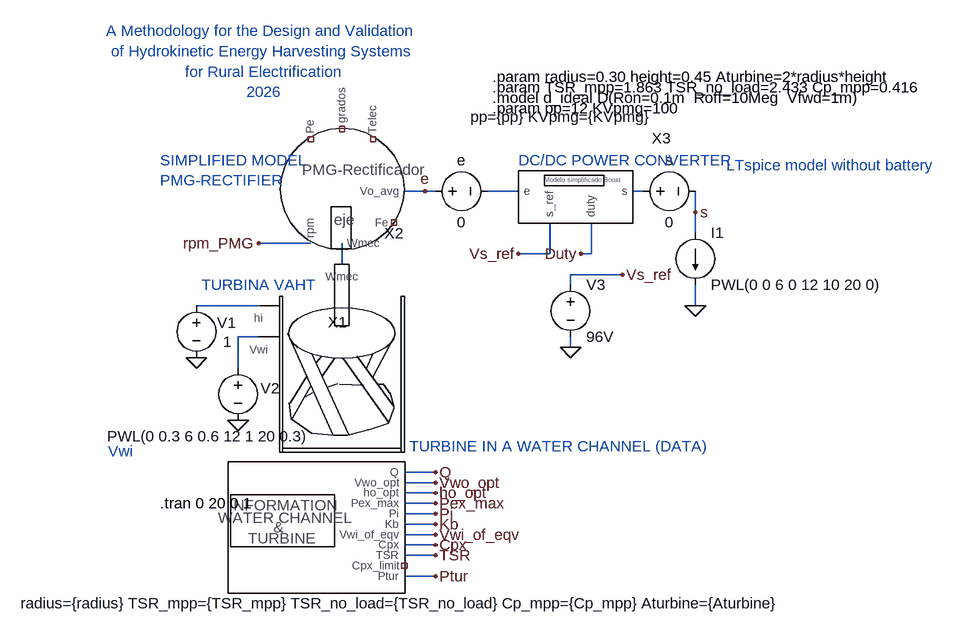
[diagram p0: schematic test_1.asc]
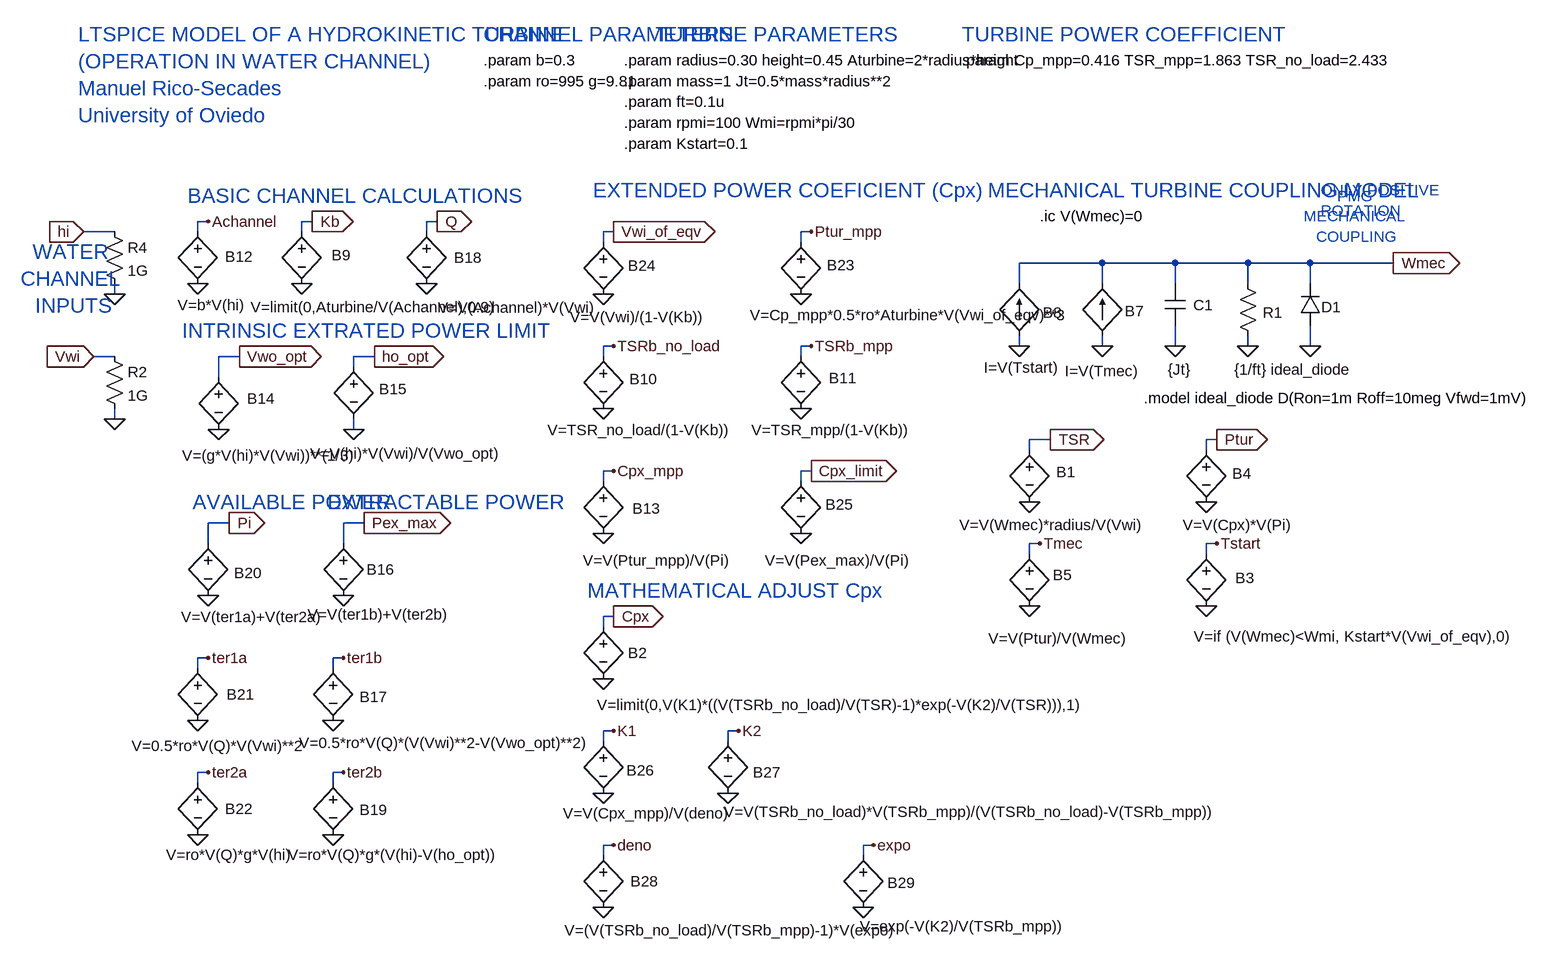
[diagram p1: sub-circuit turbina_canal.asc]
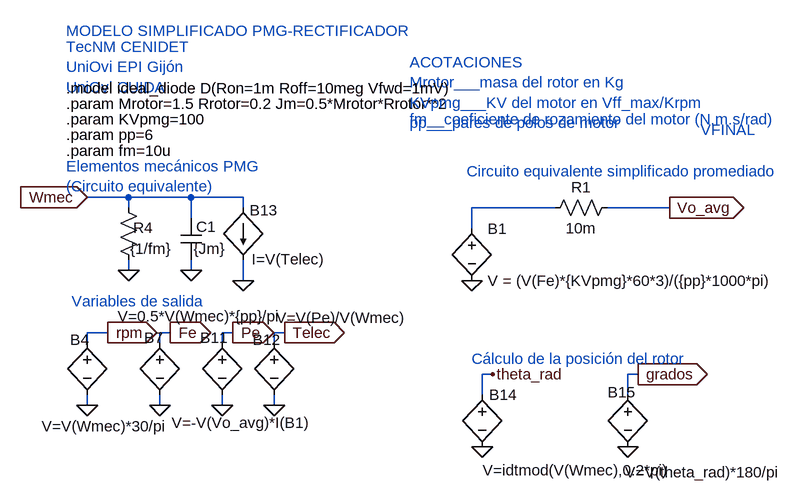
[diagram p2: sub-circuit pmg_con_rect_simple.asc]
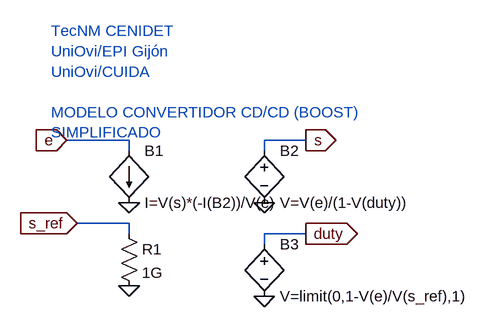
[diagram p3: sub-circuit modelo_cc_cc_boost.asc]
test_1.asc, the LTspice schematic file:
Version 4.1
SHEET 1 1700 736
WIRE -560 -480 -592 -480
WIRE -544 -480 -560 -480
WIRE -416 -480 -464 -480
WIRE -224 -480 -240 -480
WIRE -144 -448 -144 -480
WIRE -144 -416 -144 -448
WIRE -736 -400 -816 -400
WIRE -368 -384 -368 -432
WIRE -368 -384 -416 -384
WIRE -304 -384 -304 -432
WIRE -304 -384 -320 -384
WIRE -688 -368 -688 -400
WIRE -256 -352 -336 -352
WIRE -336 -336 -336 -352
WIRE -816 -304 -912 -304
WIRE -144 -304 -144 -336
WIRE -816 -256 -848 -256
WIRE -336 -240 -336 -256
WIRE -848 -208 -848 -256
WIRE -544 -48 -592 -48
WIRE -544 -32 -592 -32
WIRE -544 -16 -592 -16
WIRE -544 0 -592 0
WIRE -544 16 -592 16
WIRE -544 32 -592 32
WIRE -544 48 -592 48
WIRE -544 64 -592 64
WIRE -544 80 -592 80
WIRE -544 112 -592 112
FLAG -912 -224 0
FLAG -848 -128 0
FLAG -544 64 Cpx
FLAG -544 80 TSR
FLAG -544 112 Ptur
FLAG -560 -480 e
FLAG -816 -400 rpm_PMG
FLAG -544 -48 Q
FLAG -544 -32 Vwo_opt
FLAG -544 0 Pex_max
FLAG -544 16 Pi
FLAG -544 32 Kb
FLAG -544 -16 ho_opt
FLAG -544 48 Vwi_of_eqv
FLAG -144 -304 0
FLAG -416 -384 Vs_ref
FLAG -320 -384 Duty
FLAG -336 -240 0
FLAG -256 -352 Vs_ref
FLAG -144 -448 s
SYMBOL turbina_canal -688 -272 R0
WINDOW 0 -7 9 Bottom 2
WINDOW 39 100 441 Bottom 2
SYMATTR InstName X1
SYMATTR SpiceLine radius={radius} TSR_mpp={TSR_mpp} TSR_no_load={TSR_no_load} Cp_mpp={Cp_mpp} Aturbine={Aturbine}
SYMBOL voltage -912 -320 R0
WINDOW 0 32 42 Left 2
WINDOW 3 41 71 Left 2
WINDOW 123 0 0 Left 0
WINDOW 39 0 0 Left 0
SYMATTR InstName V1
SYMATTR Value 1
SYMBOL voltage -848 -224 R0
WINDOW 0 35 47 Left 2
WINDOW 3 -201 121 Left 2
WINDOW 123 0 0 Left 0
WINDOW 39 0 0 Left 0
SYMATTR InstName V2
SYMATTR Value PWL(0 0.3 6 0.6 12 1 20 0.3)
SYMBOL pmg_con_rect_simple -656 -512 R0
WINDOW 0 48 112 Bottom 2
WINDOW 39 306 -67 Bottom 2
SYMATTR InstName X2
SYMATTR SpiceLine pp={pp} KVpmg={KVpmg}
SYMBOL voltage -560 -480 R270
WINDOW 0 32 56 VTop 2
WINDOW 3 -32 56 VBottom 2
SYMATTR InstName e
SYMATTR Value 0
SYMBOL modelo_cc_cc_boost -336 -464 R0
WINDOW 0 140 -82 Bottom 2
SYMATTR InstName X3
SYMBOL current -144 -416 R0
WINDOW 123 0 0 Left 0
WINDOW 39 0 0 Left 0
SYMATTR InstName I1
SYMATTR Value PWL(0 0 6 0 12 10 20 0)
SYMBOL voltage -240 -480 R270
WINDOW 0 32 56 VTop 2
WINDOW 3 -32 56 VBottom 2
SYMATTR InstName s
SYMATTR Value 0
SYMBOL voltage -336 -352 R0
WINDOW 123 0 0 Left 0
WINDOW 39 0 0 Left 0
SYMATTR InstName V3
SYMATTR Value 96V
TEXT -968 0 Left 2 !.tran 0 20 0 1
TEXT -456 -624 Left 2 !.model d_ideal D(Ron=0.1m  Roff=10Meg  Vfwd=1m)
TEXT -456 -608 Left 2 !.param pp=12 KVpmg=100
TEXT -456 -640 Left 2 !.param TSR_mpp=1.863 TSR_no_load=2.433 Cp_mpp=0.416
TEXT -456 -656 Left 2 !.param radius=0.30 height=0.45 Aturbine=2*radius*height
TEXT -808 -680 Center 2 ;A Methodology for the Design and Validation \nof Hydrokinetic Energy Harvesting Systems \nfor Rural Electrification\n2026
TEXT -416 -528 Left 2 ;DC/DC POWER CONVERTER
TEXT -584 -88 Left 2 ;TURBINE IN A WATER CHANNEL (DATA)
TEXT -968 -528 Left 2 ;SIMPLIFIED MODEL \nPMG-RECTIFIER
TEXT -1048 -80 Left 2 ;Vwi
TEXT -904 -336 Left 2 ;TURBINA VAHT
TEXT -96 -520 Left 2 ;LTspice model without battery

turbina_canal.asc, the sub-circuit schematic file:
Version 4.1
SHEET 1 1700 736
WIRE -1392 -544 -1408 -544
WIRE -1232 -544 -1248 -544
WIRE -1040 -544 -1056 -544
WIRE -1536 -528 -1584 -528
WIRE -1408 -528 -1408 -544
WIRE -1248 -528 -1248 -544
WIRE -1056 -528 -1056 -544
WIRE -768 -528 -784 -528
WIRE -464 -528 -480 -528
WIRE -784 -512 -784 -528
WIRE -480 -512 -480 -528
WIRE -16 -480 -144 -480
WIRE 96 -480 -16 -480
WIRE 208 -480 96 -480
WIRE 304 -480 208 -480
WIRE 432 -480 304 -480
WIRE -144 -448 -144 -480
WIRE -16 -448 -16 -480
WIRE 96 -448 96 -480
WIRE 208 -448 208 -480
WIRE 304 -448 304 -480
WIRE -1536 -432 -1536 -448
WIRE -768 -352 -784 -352
WIRE -464 -352 -480 -352
WIRE -144 -352 -144 -368
WIRE -16 -352 -16 -368
WIRE 96 -352 96 -384
WIRE 208 -352 208 -368
WIRE 304 -352 304 -384
WIRE -1536 -336 -1568 -336
WIRE -1344 -336 -1376 -336
WIRE -1136 -336 -1168 -336
WIRE -784 -336 -784 -352
WIRE -480 -336 -480 -352
WIRE -1168 -320 -1168 -336
WIRE -1376 -304 -1376 -336
WIRE -1536 -240 -1536 -256
WIRE -1168 -224 -1168 -240
WIRE -96 -208 -128 -208
WIRE 160 -208 144 -208
WIRE -128 -192 -128 -208
WIRE 144 -192 144 -208
WIRE -768 -160 -784 -160
WIRE -464 -160 -480 -160
WIRE -784 -144 -784 -160
WIRE -480 -144 -480 -160
WIRE -1360 -80 -1392 -80
WIRE -1152 -80 -1184 -80
WIRE -1392 -48 -1392 -80
WIRE -1184 -48 -1184 -80
WIRE -112 -48 -128 -48
WIRE 160 -48 144 -48
WIRE -128 -32 -128 -48
WIRE 144 -32 144 -48
WIRE -768 64 -784 64
WIRE -784 80 -784 64
WIRE -1392 128 -1408 128
WIRE -1184 128 -1200 128
WIRE -1408 144 -1408 128
WIRE -1200 144 -1200 128
WIRE -768 240 -784 240
WIRE -576 240 -592 240
WIRE -784 256 -784 240
WIRE -592 256 -592 240
WIRE -1392 304 -1408 304
WIRE -1184 304 -1200 304
WIRE -1408 320 -1408 304
WIRE -1200 320 -1200 304
WIRE -768 416 -784 416
WIRE -368 416 -384 416
WIRE -784 432 -784 416
WIRE -384 432 -384 416
FLAG -1568 -336 Vwi
IOPIN -1568 -336 In
FLAG -1536 -240 0
FLAG -128 -112 0
FLAG -96 -208 TSR
IOPIN -96 -208 Out
FLAG -784 160 0
FLAG -768 64 Cpx
IOPIN -768 64 Out
FLAG 144 -112 0
FLAG 160 -208 Ptur
IOPIN 160 -208 Out
FLAG -128 48 0
FLAG -112 -48 Tmec
FLAG -16 -352 0
FLAG 96 -352 0
FLAG 432 -480 Wmec
IOPIN 432 -480 Out
FLAG 208 -352 0
FLAG -144 -352 0
FLAG -1248 -448 0
FLAG -1232 -544 Kb
IOPIN -1232 -544 Out
FLAG -784 -256 0
FLAG -768 -352 TSRb_no_load
FLAG -480 -256 0
FLAG -464 -352 TSRb_mpp
FLAG -1584 -528 hi
IOPIN -1584 -528 In
FLAG -1536 -432 0
FLAG -1408 -448 0
FLAG -1392 -544 Achannel
FLAG -784 -64 0
FLAG -768 -160 Cpx_mpp
FLAG -1376 -224 0
FLAG -1344 -336 Vwo_opt
IOPIN -1344 -336 Out
FLAG -1136 -336 ho_opt
IOPIN -1136 -336 Out
FLAG -1168 -224 0
FLAG -1152 -80 Pex_max
IOPIN -1152 -80 Out
FLAG -1184 32 0
FLAG -1200 224 0
FLAG -1184 128 ter1b
FLAG -1056 -448 0
FLAG -1040 -544 Q
IOPIN -1040 -544 Out
FLAG -1200 400 0
FLAG -1184 304 ter2b
FLAG -1360 -80 Pi
IOPIN -1360 -80 Out
FLAG -1392 32 0
FLAG -1408 224 0
FLAG -1392 128 ter1a
FLAG -1408 400 0
FLAG -1392 304 ter2a
FLAG -480 -432 0
FLAG -464 -528 Ptur_mpp
FLAG -784 -432 0
FLAG -768 -528 Vwi_of_eqv
IOPIN -768 -528 Out
FLAG -480 -64 0
FLAG -464 -160 Cpx_limit
IOPIN -464 -160 Out
FLAG -784 336 0
FLAG -768 240 K1
FLAG -592 336 0
FLAG -576 240 K2
FLAG -784 512 0
FLAG -768 416 deno
FLAG -384 512 0
FLAG -368 416 expo
FLAG 144 48 0
FLAG 160 -48 Tstart
FLAG 304 -352 0
SYMBOL res -1552 -352 R0
SYMATTR InstName R2
SYMATTR Value 1G
SYMBOL bv -128 -208 R0
WINDOW 3 -108 131 Left 2
WINDOW 0 41 50 Left 2
SYMATTR Value V=V(Wmec)*radius/V(Vwi)
SYMATTR InstName B1
SYMBOL bv -784 64 R0
WINDOW 3 -10 136 Left 2
WINDOW 0 38 56 Left 2
SYMATTR Value V=limit(0,V(K1)*((V(TSRb_no_load)/V(TSR)-1)*exp(-V(K2)/V(TSR))),1)
SYMATTR InstName B2
SYMBOL bv 144 -208 R0
WINDOW 3 -36 131 Left 2
WINDOW 0 40 52 Left 2
SYMATTR Value V=V(Cpx)*V(Pi)
SYMATTR InstName B4
SYMBOL bv -128 -48 R0
WINDOW 3 -63 146 Left 2
WINDOW 0 36 48 Left 2
SYMATTR Value V=V(Ptur)/V(Wmec)
SYMATTR InstName B5
SYMBOL bi -16 -368 R180
WINDOW 0 -64 38 Left 2
WINDOW 3 -56 -54 Left 2
SYMATTR InstName B7
SYMATTR Value I=V(Tmec)
SYMBOL cap 80 -448 R0
WINDOW 3 5 132 Left 2
WINDOW 0 44 33 Left 2
SYMATTR Value {Jt}
SYMATTR InstName C1
SYMBOL res 192 -464 R0
WINDOW 3 -5 148 Left 2
WINDOW 0 39 60 Left 2
SYMATTR Value {1/ft}
SYMATTR InstName R1
SYMBOL bi -144 -368 R180
WINDOW 0 -66 36 Left 2
WINDOW 3 -61 -49 Left 2
SYMATTR InstName B8
SYMATTR Value I=V(Tstart)
SYMBOL bv -1248 -544 R0
WINDOW 0 46 52 Left 2
WINDOW 3 -79 132 Left 2
SYMATTR InstName B9
SYMATTR Value V=limit(0,Aturbine/V(Achannel),0.9)
SYMBOL bv -784 -352 R0
WINDOW 0 40 51 Left 2
WINDOW 3 -86 129 Left 2
SYMATTR InstName B10
SYMATTR Value V=TSR_no_load/(1-V(Kb))
SYMBOL bv -480 -352 R0
WINDOW 0 43 49 Left 2
WINDOW 3 -76 129 Left 2
SYMATTR InstName B11
SYMATTR Value V=TSR_mpp/(1-V(Kb))
SYMBOL res -1552 -544 R0
SYMATTR InstName R4
SYMATTR Value 1G
SYMBOL bv -1408 -544 R0
WINDOW 0 42 54 Left 2
WINDOW 3 -31 129 Left 2
SYMATTR InstName B12
SYMATTR Value V=b*V(hi)
SYMBOL bv -784 -160 R0
WINDOW 0 45 58 Left 2
WINDOW 3 -31 138 Left 2
SYMATTR InstName B13
SYMATTR Value V=V(Ptur_mpp)/V(Pi)
SYMBOL bv -1376 -320 R0
WINDOW 0 44 49 Left 2
WINDOW 3 -56 136 Left 2
SYMATTR InstName B14
SYMATTR Value V=(g*V(hi)*V(Vwi))**(1/3)
SYMBOL bv -1168 -336 R0
WINDOW 0 39 50 Left 2
WINDOW 3 -67 149 Left 2
SYMATTR InstName B15
SYMATTR Value V=V(hi)*V(Vwi)/V(Vwo_opt)
SYMBOL bv -1184 -64 R0
WINDOW 0 36 56 Left 2
WINDOW 3 -55 125 Left 2
SYMATTR InstName B16
SYMATTR Value V=V(ter1b)+V(ter2b)
SYMBOL bv -1200 128 R0
WINDOW 0 41 60 Left 2
WINDOW 3 -52 131 Left 2
SYMATTR InstName B17
SYMATTR Value V=0.5*ro*V(Q)*(V(Vwi)**2-V(Vwo_opt)**2)
SYMBOL bv -1056 -544 R0
WINDOW 0 42 56 Left 2
WINDOW 3 18 133 Left 2
SYMATTR InstName B18
SYMATTR Value V=V(Achannel)*V(Vwi)
SYMBOL bv -1200 304 R0
WINDOW 0 41 58 Left 2
WINDOW 3 -69 127 Left 2
SYMATTR InstName B19
SYMATTR Value V=ro*V(Q)*g*(V(hi)-V(ho_opt))
SYMBOL bv -1392 -64 R0
WINDOW 0 40 61 Left 2
WINDOW 3 -42 129 Left 2
SYMATTR InstName B20
SYMATTR Value V=V(ter1a)+V(ter2a)
SYMBOL bv -1408 128 R0
WINDOW 0 44 56 Left 2
WINDOW 3 -102 135 Left 2
SYMATTR InstName B21
SYMATTR Value V=0.5*ro*V(Q)*V(Vwi)**2
SYMBOL bv -1408 304 R0
WINDOW 0 42 56 Left 2
WINDOW 3 -49 127 Left 2
SYMATTR InstName B22
SYMATTR Value V=ro*V(Q)*g*V(hi)
SYMBOL bv -480 -528 R0
WINDOW 0 40 51 Left 2
WINDOW 3 -78 128 Left 2
SYMATTR InstName B23
SYMATTR Value V=Cp_mpp*0.5*ro*Aturbine*V(Vwi_of_eqv)**3
SYMBOL bv -784 -528 R0
WINDOW 0 38 52 Left 2
WINDOW 3 -51 131 Left 2
SYMATTR InstName B24
SYMATTR Value V=V(Vwi)/(1-V(Kb))
SYMBOL bv -480 -160 R0
WINDOW 0 38 52 Left 2
WINDOW 3 -55 138 Left 2
SYMATTR InstName B25
SYMATTR Value V=V(Pex_max)/V(Pi)
SYMBOL bv -784 240 R0
WINDOW 0 36 61 Left 2
WINDOW 3 -62 127 Left 2
SYMATTR InstName B26
SYMATTR Value V=V(Cpx_mpp)/V(deno)
SYMBOL bv -592 240 R0
WINDOW 0 38 64 Left 2
WINDOW 3 -6 125 Left 2
SYMATTR InstName B27
SYMATTR Value V=V(TSRb_no_load)*V(TSRb_mpp)/(V(TSRb_no_load)-V(TSRb_mpp))
SYMBOL bv -784 416 R0
WINDOW 0 42 56 Left 2
WINDOW 3 -60 131 Left 2
SYMATTR InstName B28
SYMATTR Value V=(V(TSRb_no_load)/V(TSRb_mpp)-1)*V(expo)
SYMBOL bv -384 416 R0
WINDOW 0 37 58 Left 2
WINDOW 3 -5 125 Left 2
SYMATTR InstName B29
SYMATTR Value V=exp(-V(K2)/V(TSRb_mpp))
SYMBOL bv 144 -48 R0
WINDOW 0 45 53 Left 2
WINDOW 3 -19 143 Left 2
SYMATTR InstName B3
SYMATTR Value V=if (V(Wmec)<Wmi, Kstart*V(Vwi_of_eqv),0)
SYMBOL diode 320 -384 R180
WINDOW 0 -32 28 Left 2
WINDOW 3 -47 -68 Left 2
SYMATTR InstName D1
SYMATTR Value ideal_diode
TEXT -752 -792 Left 2 !.param radius=0.30 height=0.45 Aturbine=2*radius*height
TEXT -232 -792 Left 2 !.param Cp_mpp=0.416 TSR_mpp=1.863 TSR_no_load=2.433
TEXT -752 -760 Left 2 !.param mass=1 Jt=0.5*mass*radius**2
TEXT -112 -552 Left 2 !.ic V(Wmec)=0
TEXT -752 -696 Left 2 !.param rpmi=100 Wmi=rpmi*pi/30
TEXT -752 -728 Left 2 !.param ft=0.1u
TEXT -752 -664 Left 2 !.param Kstart=0.1
TEXT -704 -832 Left 3 ;TURBINE PARAMETERS
TEXT -232 -832 Left 3 ;TURBINE POWER COEFFICIENT
TEXT -968 -832 Left 3 ;CHANNEL PARAMETERS
TEXT -968 -792 Left 2 !.param b=0.3
TEXT -968 -760 Left 2 !.param ro=995 g=9.81
TEXT -800 -592 Left 3 ;EXTENDED POWER COEFICIENT (Cpx)
TEXT -808 24 Left 3 ;MATHEMATICAL ADJUST Cpx
TEXT -1416 -112 Left 3 ;AVAILABLE POWER
TEXT -1208 -112 Left 3 ;EXTRACTABLE POWER
TEXT -192 -592 Left 3 ;MECHANICAL TURBINE COUPLING MODEL
TEXT -1432 -376 Left 3 ;INTRINSIC EXTRATED POWER LIMIT
TEXT 376 -552 Center 2 ;PMG \nMECHANICAL \nCOUPLING
TEXT -1600 -456 Center 3 ;WATER \nCHANNEL \nINPUTS
TEXT -1592 -832 Left 3 ;LTSPICE MODEL OF A HYDROKINETIC TURBINE\n(OPERATION IN WATER CHANNEL)\nManuel Rico-Secades\nUniversity of Oviedo
TEXT -1424 -584 Left 3 ;BASIC CHANNEL CALCULATIONS
TEXT 48 -272 Left 2 !.model ideal_diode D(Ron=1m Roff=10meg Vfwd=1mV)
TEXT 320 -592 Left 2 ;ONLY POSITIVE\nROTATION

pmg_con_rect_simple.asc, the sub-circuit schematic file:
Version 4.1
SHEET 1 1092 1236
WIRE -816 464 -880 464
WIRE -720 464 -816 464
WIRE -640 464 -720 464
WIRE -816 480 -816 464
WIRE -640 480 -640 464
WIRE -160 480 -288 480
WIRE 16 480 -80 480
WIRE -720 496 -720 464
WIRE -288 512 -288 480
WIRE -816 576 -816 560
WIRE -720 576 -720 560
WIRE -640 592 -640 560
WIRE -848 672 -880 672
WIRE -752 672 -768 672
WIRE -656 672 -672 672
WIRE -576 672 -592 672
WIRE -880 688 -880 672
WIRE -768 688 -768 672
WIRE -672 688 -672 672
WIRE -592 688 -592 672
WIRE -256 736 -272 736
WIRE -32 736 -48 736
WIRE -272 768 -272 736
WIRE -48 768 -48 736
WIRE -880 784 -880 768
WIRE -768 784 -768 768
WIRE -672 784 -672 768
WIRE -592 784 -592 768
FLAG -880 464 Wmec
IOPIN -880 464 In
FLAG -720 576 0
FLAG -880 784 0
FLAG -848 672 rpm
IOPIN -848 672 Out
FLAG -768 784 0
FLAG -752 672 Fe
IOPIN -752 672 Out
FLAG -672 784 0
FLAG -656 672 Pe
IOPIN -656 672 Out
FLAG -592 784 0
FLAG -576 672 Telec
IOPIN -576 672 Out
FLAG -640 592 0
FLAG -816 576 0
FLAG -272 848 0
FLAG -256 736 theta_rad
FLAG -48 848 0
FLAG -32 736 grados
IOPIN -32 736 Out
FLAG 16 480 Vo_avg
IOPIN 16 480 Out
FLAG -288 592 0
SYMBOL cap -736 496 R0
WINDOW 0 24 13 Left 2
WINDOW 3 20 47 Left 2
SYMATTR InstName C1
SYMATTR Value {Jm}
SYMBOL bv -880 672 R0
WINDOW 3 -70 144 Left 2
WINDOW 0 -26 11 Left 2
SYMATTR Value V=V(Wmec)*30/pi
SYMATTR InstName B4
SYMBOL bv -768 672 R0
WINDOW 3 -65 -25 Left 2
WINDOW 0 -24 8 Left 2
SYMATTR Value V=0.5*V(Wmec)*{pp}/pi
SYMATTR InstName B7
SYMBOL bv -672 672 R0
WINDOW 3 -78 139 Left 2
WINDOW 0 -34 8 Left 2
SYMATTR Value V=-V(Vo_avg)*I(B1)
SYMATTR InstName B11
SYMBOL bv -592 672 R0
WINDOW 3 3 -23 Left 2
WINDOW 0 -33 11 Left 2
SYMATTR Value V=V(Pe)/V(Wmec)
SYMATTR InstName B12
SYMBOL bi -640 480 R0
WINDOW 0 10 4 Left 2
WINDOW 3 13 79 Left 2
SYMATTR InstName B13
SYMATTR Value I=V(Telec)
SYMBOL res -832 464 R0
WINDOW 0 23 47 Left 2
WINDOW 3 18 79 Left 2
SYMATTR InstName R4
SYMATTR Value {1/fm}
SYMBOL bv -272 752 R0
WINDOW 0 11 16 Left 2
WINDOW 3 1 132 Left 2
SYMATTR InstName B14
SYMATTR Value V=idtmod(V(Wmec),0.2*pi)
SYMBOL bv -48 752 R0
WINDOW 0 -31 12 Left 2
WINDOW 3 -4 135 Left 2
SYMATTR InstName B15
SYMATTR Value V=V(theta_rad)*180/pi
SYMBOL bv -288 496 R0
SYMATTR InstName B1
SYMATTR Value V = (V(Fe)*{KVpmg}*60*3)/({pp}*1000*pi)
SYMBOL res -64 464 R90
WINDOW 0 0 56 VBottom 2
WINDOW 3 32 56 VTop 2
SYMATTR InstName R1
SYMATTR Value 10m
TEXT -912 320 Left 2 !.param Mrotor=1.5 Rrotor=0.2 Jm=0.5*Mrotor*Rrotor**2
TEXT -912 344 Left 2 !.param KVpmg=100
TEXT -912 368 Left 2 !.param pp=6
TEXT -912 208 Left 2 ;MODELO SIMPLIFICADO PMG-RECTIFICADOR
TEXT -384 256 Left 2 ;ACOTACIONES\nMrotor___masa del rotor en Kg\nKVpmg___KV del motor en Vff_max/Krpm\npp___pares de polos de motor
TEXT -288 712 Left 2 ;Cálculo de la posición del rotor
TEXT -904 624 Left 2 ;Variables de salida
TEXT -384 344 Left 2 ;fm__coeficiente de rozamiento del motor (N.m.s/rad)
TEXT -912 392 Left 2 !.param fm=10u
TEXT -912 416 Left 2 ;Elementos mecánicos PMG\n(Circuito equivalente)
TEXT -296 424 Left 2 ;Circuito equivalente simplificado promediado
TEXT -912 232 Left 2 ;TecNM CENIDET \nUniOvi EPI Gijón\nUniOvi CUIDA
TEXT -912 296 Left 2 !.model ideal_diode D(Ron=1m Roff=10meg Vfwd=1mV)
TEXT 64 360 Left 2 ;VFINAL

modelo_cc_cc_boost.asc, the sub-circuit schematic file:
Version 4.1
SHEET 1 1452 740
WIRE 0 -48 -96 -48
WIRE 272 -48 208 -48
WIRE 0 -32 0 -48
WIRE 208 -32 208 -48
WIRE 0 80 -80 80
WIRE 0 96 0 80
WIRE 272 96 208 96
WIRE 208 112 208 96
FLAG -80 80 s_ref
IOPIN -80 80 In
FLAG 0 176 0
FLAG -96 -48 e
IOPIN -96 -48 In
FLAG 0 48 0
FLAG 272 -48 s
IOPIN 272 -48 Out
FLAG 208 48 0
FLAG 272 96 duty
IOPIN 272 96 Out
FLAG 208 192 0
SYMBOL res -16 80 R0
SYMATTR InstName R1
SYMATTR Value 1G
SYMBOL bi 0 -32 R0
SYMATTR InstName B1
SYMATTR Value I=V(s)*(-I(B2))/V(e)
SYMBOL bv 208 -48 R0
SYMATTR InstName B2
SYMATTR Value V=V(e)/(1-V(duty))
SYMBOL bv 208 96 R0
SYMATTR InstName B3
SYMATTR Value V=limit(0,1-V(e)/V(s_ref),1)
TEXT -120 -216 Left 2 ;TecNM CENIDET\nUniOvi/EPI Gijón\nUniOvi/CUIDA\n \nMODELO CONVERTIDOR CD/CD (BOOST)\nSIMPLIFICADO

The netlist it stands for:
* test_1.asc
X§X1 N005 N004 N003 Cpx TSR Kb Vwo_opt ho_opt Pex_max Vwi_of_eqv Ptur Q NC_01 Pi turbina_canal params: radius={radius} TSR_mpp={TSR_mpp} TSR_no_load={TSR_no_load} Cp_mpp={Cp_mpp} Aturbine={Aturbine}
V1 N004 0 1
V2 N005 0 PWL(0 0.3 6 0.6 12 1 20 0.3)
X§X2 N003 NC_02 NC_03 NC_04 rpm_PMG NC_05 e pmg_con_rect_simple params: pp={pp} KVpmg={KVpmg}
V§e e N001 0
X§X3 N001 Vs_ref Duty N002 modelo_cc_cc_boost
I1 s 0 PWL(0 0 6 0 12 10 20 0)
V§s N002 s 0
V3 Vs_ref 0 96V

* block symbol definitions
.subckt turbina_canal Vwi hi Wmec Cpx TSR Kb Vwo_opt ho_opt Pex_max Vwi_of_eqv Ptur Q Cpx_limit Pi
R2 Vwi 0 1G
B1 TSR 0 V=V(Wmec)*radius/V(Vwi)
B2 Cpx 0 V=limit(0,V(K1)*((V(TSRb_no_load)/V(TSR)-1)*exp(-V(K2)/V(TSR))),1)
B4 Ptur 0 V=V(Cpx)*V(Pi)
B5 Tmec 0 V=V(Ptur)/V(Wmec)
B7 0 Wmec I=V(Tmec)
C1 Wmec 0 {Jt}
R1 Wmec 0 {1/ft}
B8 0 Wmec I=V(Tstart)
B9 Kb 0 V=limit(0,Aturbine/V(Achannel),0.9)
B10 TSRb_no_load 0 V=TSR_no_load/(1-V(Kb))
B11 TSRb_mpp 0 V=TSR_mpp/(1-V(Kb))
R4 hi 0 1G
B12 Achannel 0 V=b*V(hi)
B13 Cpx_mpp 0 V=V(Ptur_mpp)/V(Pi)
B14 Vwo_opt 0 V=(g*V(hi)*V(Vwi))**(1/3)
B15 ho_opt 0 V=V(hi)*V(Vwi)/V(Vwo_opt)
B16 Pex_max 0 V=V(ter1b)+V(ter2b)
B17 ter1b 0 V=0.5*ro*V(Q)*(V(Vwi)**2-V(Vwo_opt)**2)
B18 Q 0 V=V(Achannel)*V(Vwi)
B19 ter2b 0 V=ro*V(Q)*g*(V(hi)-V(ho_opt))
B20 Pi 0 V=V(ter1a)+V(ter2a)
B21 ter1a 0 V=0.5*ro*V(Q)*V(Vwi)**2
B22 ter2a 0 V=ro*V(Q)*g*V(hi)
B23 Ptur_mpp 0 V=Cp_mpp*0.5*ro*Aturbine*V(Vwi_of_eqv)**3
B24 Vwi_of_eqv 0 V=V(Vwi)/(1-V(Kb))
B25 Cpx_limit 0 V=V(Pex_max)/V(Pi)
B26 K1 0 V=V(Cpx_mpp)/V(deno)
B27 K2 0 V=V(TSRb_no_load)*V(TSRb_mpp)/(V(TSRb_no_load)-V(TSRb_mpp))
B28 deno 0 V=(V(TSRb_no_load)/V(TSRb_mpp)-1)*V(expo)
B29 expo 0 V=exp(-V(K2)/V(TSRb_mpp))
B3 Tstart 0 V=if (V(Wmec)<Wmi, Kstart*V(Vwi_of_eqv),0)
D1 0 Wmec ideal_diode
.param radius=0.30 height=0.45 Aturbine=2*radius*height
.param Cp_mpp=0.416 TSR_mpp=1.863 TSR_no_load=2.433
.param mass=1 Jt=0.5*mass*radius**2
.ic V(Wmec)=0
.param rpmi=100 Wmi=rpmi*pi/30
.param ft=0.1u
.param Kstart=0.1
* TURBINE PARAMETERS
* TURBINE POWER COEFFICIENT
* CHANNEL PARAMETERS
.param b=0.3
.param ro=995 g=9.81
* EXTENDED POWER COEFICIENT (Cpx)
* MATHEMATICAL ADJUST Cpx
* AVAILABLE POWER
* EXTRACTABLE POWER
* MECHANICAL TURBINE COUPLING MODEL
* INTRINSIC EXTRATED POWER LIMIT
* PMG
* MECHANICAL
* COUPLING
* WATER
* CHANNEL
* INPUTS
* LTSPICE MODEL OF A HYDROKINETIC TURBINE
* (OPERATION IN WATER CHANNEL)
* Manuel Rico-Secades
* University of Oviedo
* BASIC CHANNEL CALCULATIONS
.model ideal_diode D(Ron=1m Roff=10meg Vfwd=1mV)
* ONLY POSITIVE
* ROTATION
.ends turbina_canal

.subckt pmg_con_rect_simple Wmec Fe grados Pe rpm Telec Vo_avg
C1 Wmec 0 {Jm}
B4 rpm 0 V=V(Wmec)*30/pi
B7 Fe 0 V=0.5*V(Wmec)*{pp}/pi
B11 Pe 0 V=-V(Vo_avg)*I(B1)
B12 Telec 0 V=V(Pe)/V(Wmec)
B13 Wmec 0 I=V(Telec)
R4 Wmec 0 {1/fm}
B14 theta_rad 0 V=idtmod(V(Wmec),0.2*pi)
B15 grados 0 V=V(theta_rad)*180/pi
B1 N001 0 V = (V(Fe)*{KVpmg}*60*3)/({pp}*1000*pi)
R1 Vo_avg N001 10m
.param Mrotor=1.5 Rrotor=0.2 Jm=0.5*Mrotor*Rrotor**2
.param KVpmg=100
.param pp=6
* MODELO SIMPLIFICADO PMG-RECTIFICADOR
* ACOTACIONES
* Mrotor___masa del rotor en Kg
* KVpmg___KV del motor en Vff_max/Krpm
* pp___pares de polos de motor
* Cálculo de la posición del rotor
* Variables de salida
* fm__coeficiente de rozamiento del motor (N.m.s/rad)
.param fm=10u
* Elementos mecánicos PMG
* (Circuito equivalente)
* Circuito equivalente simplificado promediado
* TecNM CENIDET
* UniOvi EPI Gijón
* UniOvi CUIDA
.model ideal_diode D(Ron=1m Roff=10meg Vfwd=1mV)
* VFINAL
.ends pmg_con_rect_simple

.subckt modelo_cc_cc_boost e s_ref duty s
R1 s_ref 0 1G
B1 e 0 I=V(s)*(-I(B2))/V(e)
B2 s 0 V=V(e)/(1-V(duty))
B3 duty 0 V=limit(0,1-V(e)/V(s_ref),1)
* TecNM CENIDET
* UniOvi/EPI Gijón
* UniOvi/CUIDA
* MODELO CONVERTIDOR CD/CD (BOOST)
* SIMPLIFICADO
.ends modelo_cc_cc_boost

.model D D
.lib standard.dio
.tran 0 20 0 1
.model d_ideal D(Ron=0.1m  Roff=10Meg  Vfwd=1m)
.param pp=12 KVpmg=100
.param TSR_mpp=1.863 TSR_no_load=2.433 Cp_mpp=0.416
.param radius=0.30 height=0.45 Aturbine=2*radius*height
* A Methodology for the Design and Validation
* of Hydrokinetic Energy Harvesting Systems
* for Rural Electrification
* 2026
* DC/DC POWER CONVERTER
* TURBINE IN A WATER CHANNEL (DATA)
* SIMPLIFIED MODEL
* PMG-RECTIFIER
* Vwi
* TURBINA VAHT
* LTspice model without battery
.backanno
.end